# Altium schematic sheet IO Connections V1.SchDoc
size A4; SheetNumber: 1; SheetTotal: 3
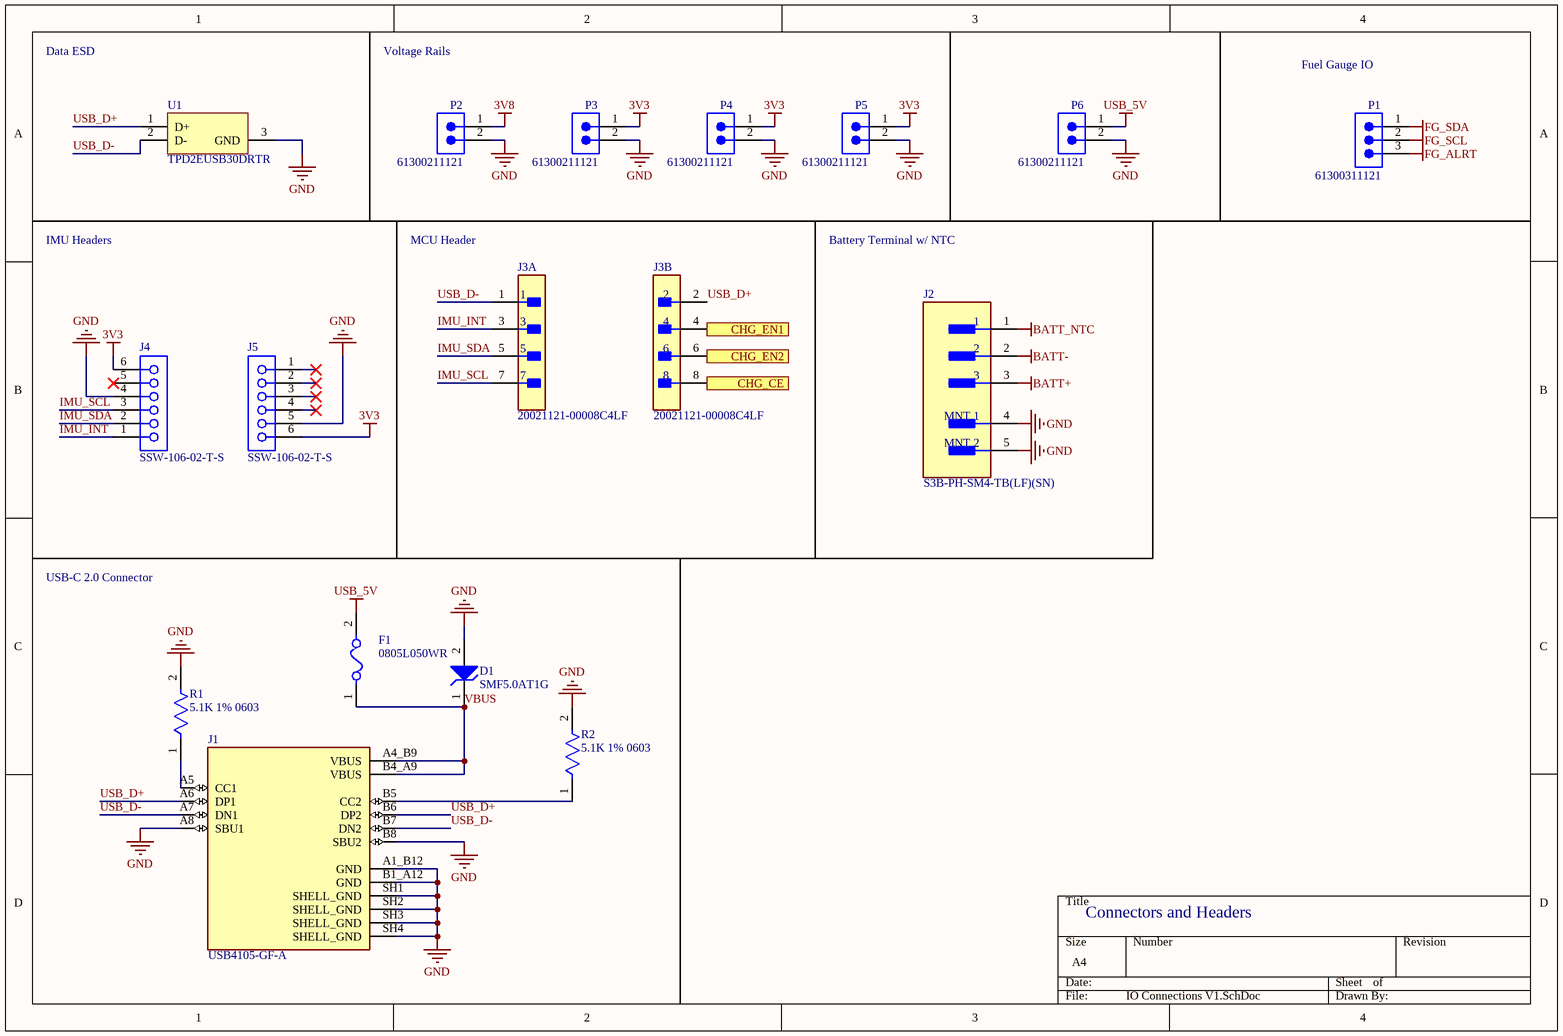
[diagram p0: IO Connections V1.SchDoc]

## Parts
D1  SMF5.0AT1G  [ONSC-SOD-123FL-2-498_V]
F1  0805L050WR  [FP-0805L-MFG]
J1  USB4105-GF-A  [GCT_USB4105-GF-A]
J2  S3B-PH-SM4-TB(LF)(SN)  [FP-S3B-PH-SM4-TB_LF_SN-MFG]
J3  20021121-00008C4LF  [FP-20021121-00008C4LF-MFG]  (parts A,B of 2)
J4  SSW-106-02-T-S  [SMTC-SSW-106-02-X-S]
J5  SSW-106-02-T-S  [SMTC-SSW-106-02-X-S]
P1  61300311121  [61300311121]
P2  61300211121  [61300211121]
P3  61300211121  [61300211121]
P4  61300211121  [61300211121]
P5  61300211121  [61300211121]
P6  61300211121  [61300211121]
R1  5.1K 1% 0603  [FP-AF0603-MFG]
R2  5.1K 1% 0603  [FP-AF0603-MFG]
U1  TPD2EUSB30DRTR  [DRT0003A]

## Ports
CHG_CE (out), CHG_EN1 (out), CHG_EN2 (out)

## Nets
3V3: J4.6 J5.6 P3.1 P4.1 P5.1
3V8: P2.1
BATT+: J2.3
BATT-: J2.2
BATT_NTC: J2.1
FG_ALRT: P1.3
FG_SCL: P1.2
FG_SDA: P1.1
GND: D1.2(A) J1.A1_B12(GND) J1.A8(SBU1) J1.B1_A12(GND) J1.B8(SBU2) J1.SH1(SHELL_GND) J1.SH2(SHELL_GND) J1.SH3(SHELL_GND) J1.SH4(SHELL_GND) J2.4(MNT_1) J2.5(MNT_2) J4.4 J5.5 P2.2 P3.2 P4.2 P5.2 P6.2 R1.2 R2.2 U1.3(GND)
USB_5V: F1.2 P6.1
CHG_CE: J3.8 ; port CHG_CE
CHG_EN1: J3.4 ; port CHG_EN1
CHG_EN2: J3.6 ; port CHG_EN2
IMU_INT: J3.3 J4.1
IMU_SCL: J3.7 J4.3
IMU_SDA: J3.5 J4.2
USB_D+: J1.A6(DP1) J1.B6(DP2) J3.2 U1.1(D+)
USB_D-: J1.A7(DN1) J1.B7(DN2) J3.1 U1.2(D-)
VBUS: D1.1(K) F1.1 J1.A4_B9(VBUS) J1.B4_A9(VBUS)
NetJ1_A5: J1.A5(CC1) R1.1
NetJ1_B5: J1.B5(CC2) R2.1

Not connected (* = marked no-connect by the designer): J4 5*; J5 1* 2* 3* 4*

## Notes on the sheet
- Data ESD
- Voltage Rails
- Fuel Gauge IO
- IMU Headers
- MCU Header
- Battery Terminal w/ NTC
- USB-C 2.0 Connector
- Connectors and Headers

## Library data of the parts
D1 = CMP-1061-00612-1: 200 W Transient Voltage Suppressor, 2-Pin SOD-123FL, Pb-Free, Tape and Reel; Manufacturer: On Semiconductor; Direction: Unidirectional; IR Max (uA): 400; V(BR) Typ (V): 6.7; PackageDescription: 2-Pin SOD, Body 1.65 x 2.7 mm; PartNumber: SMF5.0AT1G; ComponentLink3Description: Package Specification; ComponentLink3URL: http://www.onsemi.com/pub_link/Collateral/498-01.PDF; PackageVersion: Rev. D, 05/2013; Mounting Technology: Surface Mount; PackageReference: SOD-123FL-2-498; ComponentLink2URL: http://www.onsemi.com/pub_link/Collateral/SMF5.0AT1-D.PDF; DatasheetVersion: Rev. 7; ComponentLink1Description: Manufacturer URL; Packing: Tape and Reel; RoHS: Pb-Free; ComponentLink1URL: http://www.onsemi.com/; ComponentLink2Description: Datasheet
F1 = CMP-08606-000023-1: PTC RESET FUSE 6V 500MA 0805; Manufacturer: Littelfuse Inc.; Current Rating: 100A; Hold Current: 0.5A; Value: 0.15-0.85Ω; Trip Time: 0.1s; Trip Current: 1A; Device Class L2: PTC Resettable Fuses; Manufacturer Part Number: 0805L050WR; Digikey Description: PTC RESET FUSE 6V 500MA 0805; ComponentLink2URL: https://www.littelfuse.com/~/media/electronics/datasheets/resettable_ptcs/littelfuse_ptc_0805l_datasheet.pdf.pdf; Package: 0805L; RoHS: TRUE; Temperature Range Low: -40°C; Octopart: https://octopart.com/0805l050wr-littelfuse-673858; Resistance: 0.15-0.85Ω; ComponentLink2Description: Datasheet; Category: Fuse; Height: 1.25mm; Mouser Description: PTC Resettable Fuse 0.5A(hold) 1A(trip) 6VDC 100A 0.5W 0.1s 0.15Ohm SMD Solder Pad 0805 T/R; Ambient Temperature Range High: +85°C; Automotive: No; Device Class L3: unset; Lead Free: Yes; Temperature: -40°C to +85°C; Voltage Rating: 6V; Ambient Temperature Range Low: -40°C; Temperature Range High: +85°C; Device Class L1: Circuit Protection
J1 = USB4105-GF-A: MF: {'manufacturer': u'GCT'}; Package: None; Price: None; Value: *; MP: USB4105-GF-A; Availability: Unavailable
J2 = CMP-2000-07023-2: CONN HEADER SMD R/A 3POS 2MM; Voltage Rating: 100V; Gender: Male; Max Current Rating: 2A; Number of Contacts: 3; Insulation Resistance: 1GR; Contact Resistance: 10mR; Termination: Solder; Orientation: Right Angle; Insulation Color: Natural; Flammability Rating: UL94 V-0; Width: 5mm; Lead Free: Lead Free; Mount: Surface Mount; Max Operating Temperature: 85°C; Connector Type: Header; Fastening Type: Detent; Max Voltage Rating (DC): 100V; Housing Material: Polyamide; Number of Rows: 1; Housing Color: Beige; Contact Plating: Tin; Contact Shape: Square; Working Voltage: 100V; Contact Material: Copper Alloy; Contact Mating Length: 0.13inch; Contact Type: Male Pin; Max Voltage Rating (AC): 100V; Packaging: Tape and Reel; Min Operating Temperature: -25°C; Number of Positions: 3; REACH SVHC: No SVHC; Contact Finish - Mating: TIN; Color: Natural; Length: 9.9mm; Insulation Material: Nylon; Depth: 7.6mm; Current Rating: 2A; Material: Polyamide; Voltage Rating (AC): 100V; Pitch: 2mm; Series: PH; Height: 9.4mm; Number of Poles: 3; Lead Pitch: 2mm
J3 = CMP-15126-126517167-1: 20021121-00008C4LF Conn Unshrouded Header HDR 8 POS 1.27mm Solder ST Top Entry SMD Minitek127® T/R; Mating Post Length: 3.05mm; Stack Height: 3mm; Max Voltage Rating (AC): 125V; Number of Contacts: 8; Connector Type: Header, Male Pin; Current Rating: 1A; Gender: Male; Contact Resistance: 30mΩ; Orientation: Straight; Depth: 3.4mm; Min Operating Temperature: -55°C; NexarPartId: 126517167; Contact Mating Length: 3.048mm; Contact Material: Copper; Number of Rows: 2; RoHS: Compliant; Height: 5.05mm; Number of Pins: 8; REACH SVHC: No SVHC; Length: 5.08mm; Housing Color: Black; Pitch: 1.27mm; Termination: Solder; Mount: Surface Mount; Color: Black; Contact Plating: Gold; Row Spacing: 1.27mm; Number of Positions: 8; Housing Material: Thermoplastic; Max Operating Temperature: 85°C; Voltage Rating: 125V
J4 J5 = CMP-1023-00360-1: SQ Post Socket, Through-hole, Vertical, -55 to 105 degC, 2.54mm Pitch, 6-Pin, Female, RoHS; Manufacturer: Samtec; ComponentLink1URL: http://www.samtec.com; Temperature Range: -55 to 105 degC; Pitch: 2.54 mm; Mounting Technology: Through-hole; DatasheetVersion: F-214; ComponentLink1Description: Manufacturer URL; PackageVersion: CA, 6/1987; ComponentLink3Description: Package Specification; PackageDescription: Assembly, Socket Strip .016 X .031 Tail; ComponentLink2Description: Datasheet; ComponentLink2URL: http://www.samtec.com/documents/webfiles/pdf/SSW_TH.PDF; PackageReference: SSW-106-02-X-S; ComponentLink3URL: http://www.samtec.com/documents/webfiles/cpdf/SSW-1XX-XX-XXX-X-XX-XXX-XX-MKT.pdf; RoHS: True; PartNumber: SSW-106-02-T-S; Orientation: Vertical
P1 = CMP-1502-01062-4: THT Vertical Pin Header WR-PHD, Pitch 2.54 mm, Single Row, 3 pins; Connector Type: Male Pin; Number of Contacts: 3; Operating Supply Voltage: 250V; Current Rating: 3A; Pitch: 2.54mm; Contact Resistance: 20mΩ; Gender: Male; Height: 8.94mm; Color: Black; Min Operating Temperature: -40°C; Max Operating Temperature: 105°C; Mount: Through Hole; Termination: Solder; Number of Rows: 1; Packaging: Bulk; Number of Pins: 3; Lead Pitch: 2.54mm; RoHS: Compliant; Contact Plating: Gold; Number of Positions: 3; Lead Free: Lead Free; Voltage Rating: 250V; Contact Mating Length: 5.9944mm; Orientation: Vertical; Contact Material: Gold
P2-P6 = CMP-1712-00002-7: THT Vertical Pin Header WR-PHD, Pitch 2.54 mm, Single Row, 2 pins; Pitch: 2.54mm; Number of Contacts: 2; Connector Type: Male Pin; Gender: Male; Contact Resistance: 20mΩ; Operating Supply Voltage: 250V; Current Rating: 3A; Housing Material: PBT; RoHS: Compliant; Lead Free: Lead Free; Contact Material: Gold; REACH SVHC: No; Min Operating Temperature: -40°C; Termination: Through Hole; Number of Pins: 2; Contact Gender: Male; Packaging: Bulk; Lead Pitch: 2.54mm; Contact Plating: Gold; Orientation: Vertical; Mount: Through Hole; Height: 8.94mm; Color: Black; Number of Positions: 2; Contact Mating Length: 5.9944mm; Max Operating Temperature: 105°C; Voltage Rating: 250V; Number of Rows: 1
R1 R2 = CMP-03412-041991-1: Anti-Sulfurated Chip Resistors Automotive Grade 5.1kΩ 1% 100ppm/°C 0603; Max Power Dissipation: 100mW; Resistance: 5.1kR; Case/Package: 0603; Features: Moisture Resistant; Tolerance: 1%; Packaging: Tape and Reel; Number of Terminations: 2; Max Operating Temperature: 155°C; Height: 0.022inch; Temperature Coefficient: 100ppm/°C; Resistor Type: Thick Film; Width: 0.031inch; Min Operating Temperature: -55°C; Length: 0.063inch; RoHS Compliant: Yes; Series: AF
U1 = CMP-0326-00046-3: ESD Solution for Super-Speed (6 Gbps) USB 3.0 Interface, 2 Channels, -40 to +85 degC, 3-pin SOT (DRT), Green (Rohs & No Sb/Br); Manufacturer: Texas Instruments; Differential Capacitance(pF): 0.01; Breakdown Voltage(Min)(V): 9; HDMI: TRUE; IEC 61000-4-2 Air-Gap(+/- kV): 8; IO Leakage Current(nA): 10; IO Capacitance(Typ)(pF): 0.7; Mounting Technology: Surface Mount; PackageDescription: 3-Flat Lead Plastic Small Outline, 1 x 1 mm (inc leads), 0.35 mm Pitch; IEC 61000-4-2 Contact(+/- kV): 8; USB Super Speed: TRUE; Eco-Plan: Green (RoHS & no Sb/Br); USB High Speed: TRUE; PackageReference: DRT0003A; SubFamily: ESD Solution; USB Full Speed: TRUE; ComponentLink1Description: Datasheet; ComponentLink2URL: SamplesURL:http://www.ti.com/product/tpd2eusb30#samples; PackageVersion: revD, Jun-2008; ComponentLink2Description: URL Link1; 1394 / Firewire: TRUE; PartNumber: TPD2EUSB30DRTR; ComponentLink1URL: http://www.ti.com/general/docs/lit/getliterature.tsp?genericPartNumber=TPD2EUSB30&fileType=pdf; DatasheetVersion: SLVSAC2C; Serial ATA / eSATA: TRUE